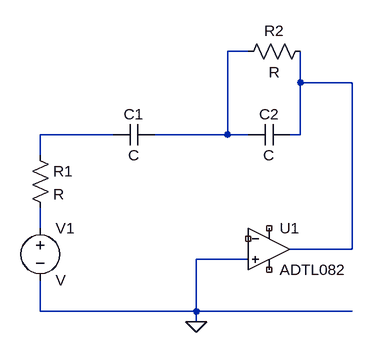
[diagram p0: schematic Draft1.asc]
Draft1.asc, the LTspice schematic file:
Version 4.1
SHEET 1 880 680
WIRE 80 -240 48 -240
WIRE 160 -192 160 -240
WIRE 240 -192 160 -192
WIRE -128 -112 -240 -112
WIRE 48 -112 48 -240
WIRE 48 -112 -64 -112
WIRE 80 -112 48 -112
WIRE 160 -112 160 -192
WIRE 160 -112 144 -112
WIRE -240 -80 -240 -112
WIRE -240 32 -240 0
WIRE 240 64 240 -192
WIRE 240 64 144 64
WIRE 80 80 0 80
WIRE -240 160 -240 112
WIRE 0 160 0 80
WIRE 0 160 -240 160
WIRE 240 160 0 160
WIRE 0 176 0 160
FLAG 0 176 0
SYMBOL OpAmps\\ADTL082 112 0 R0
SYMATTR InstName U1
SYMBOL res -256 -96 R0
SYMATTR InstName R1
SYMBOL res 176 -256 R90
WINDOW 0 0 56 VBottom 2
WINDOW 3 32 56 VTop 2
SYMATTR InstName R2
SYMBOL cap -64 -128 R90
WINDOW 0 0 32 VBottom 2
WINDOW 3 32 32 VTop 2
SYMATTR InstName C1
SYMBOL cap 144 -128 R90
WINDOW 0 0 32 VBottom 2
WINDOW 3 32 32 VTop 2
SYMATTR InstName C2
SYMBOL voltage -240 16 R0
SYMATTR InstName V1

The netlist it stands for:
* Draft1.asc
X§U1 0 NC_01 NC_02 NC_03 N002 ADTL082  ; pins In+ In- V+ V- OUT
R1 N003 N004 R
R2 N002 N001 R
C1 N001 N003 C
C2 N002 N001 C
V1 N004 0 V
.lib ADI.lib
.backanno
.end